# Altium schematic sheet LED_CLUSTER.SchDoc: PDM
size A3; CompanyName: eUSRacing; DrawnBy: Javier González; SheetNumber: 5; SheetTotal: 8
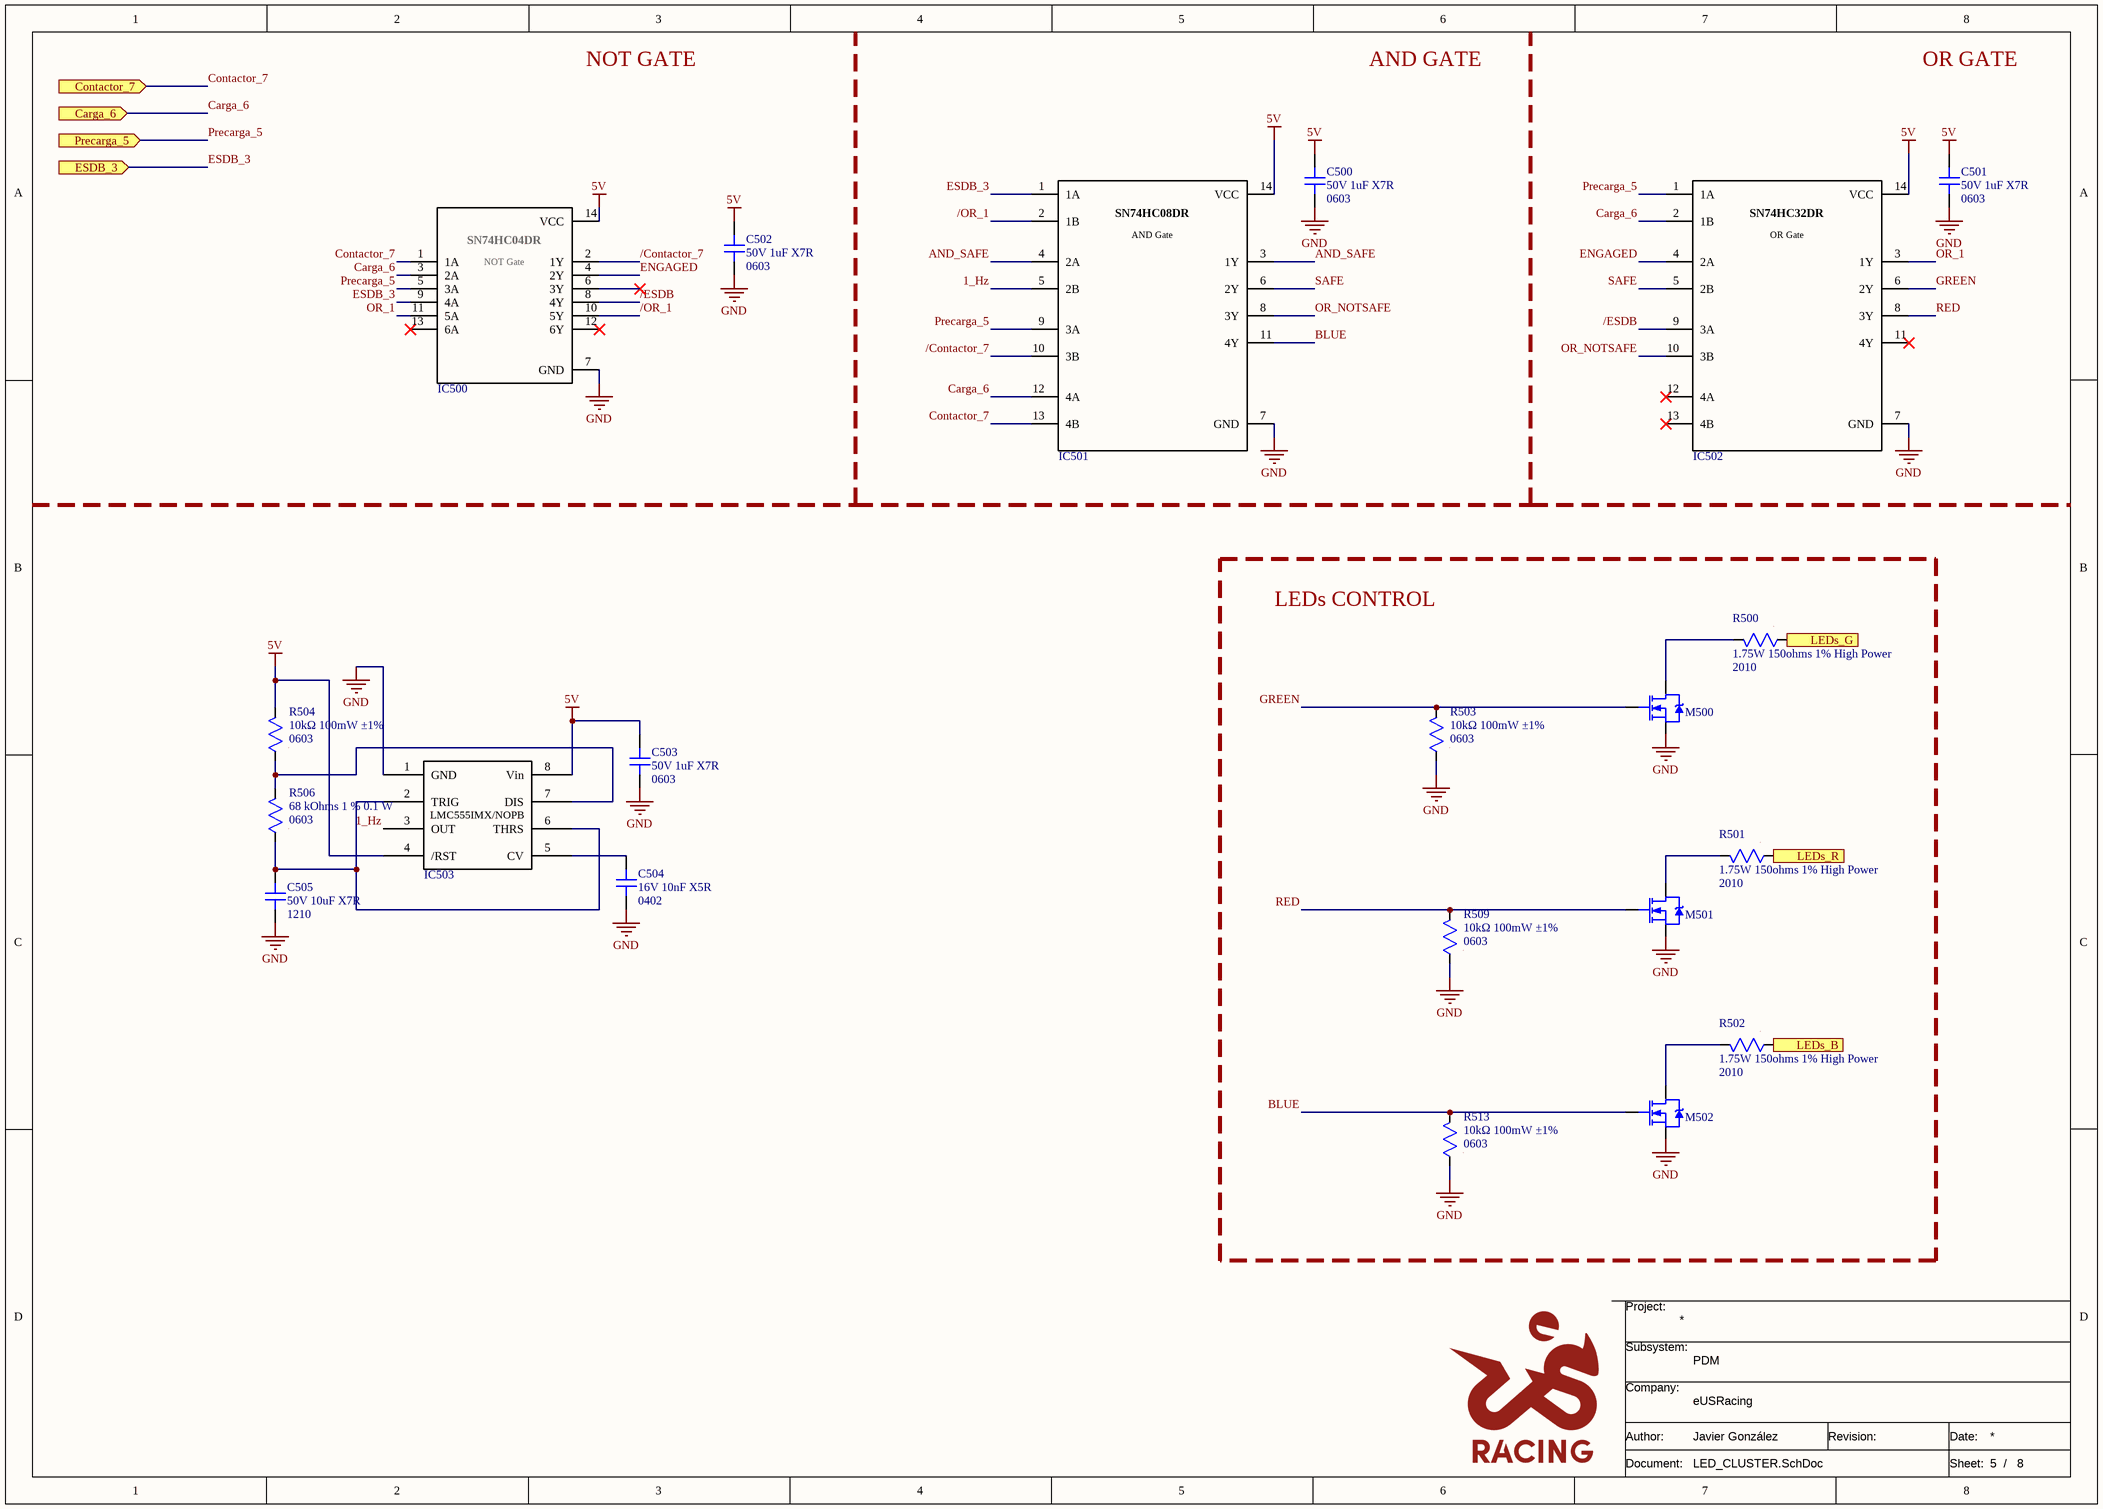
[diagram p0: LED_CLUSTER.SchDoc]

## Parts
C500  value 50V 1uF X7R  Package: 0603  [CAP SMD 0603]  (hidden comment: CAP non polarized)
C501  value 50V 1uF X7R  Package: 0603  [CAP SMD 0603]  (hidden comment: CAP non polarized)
C502  value 50V 1uF X7R  Package: 0603  [CAP SMD 0603]  (hidden comment: CAP non polarized)
C503  value 50V 1uF X7R  Package: 0603  [CAP SMD 0603]  (hidden comment: CAP non polarized)
C504  value 16V 10nF X5R  Package: 0402  [CAP SMD 0402]  (hidden comment: CAP non polarized)
C505  value 50V 10uF X7R  Package: 1210  [CAP SMD 1210]  (hidden comment: CAP non polarized)
IC500  SN74HC04DR  [SOIC-14]  (value not drawn)
IC501  SN74HC08DR  [SOIC-14]  (value not drawn)
IC502  SN74HC32DR  [SOIC-14]  (value not drawn)
IC503  LMC555IMX/NOPB  [SOIC-8]  (value not drawn)
M500  MOSFET N  [SOT-323]  (value not drawn)
M501  MOSFET N  [SOT-323]  (value not drawn)
M502  MOSFET N  [SOT-323]  (value not drawn)
R500  value 1.75W 150ohms 1% High Power  Package: 2010  [RES SMD 2010]  (hidden comment: RES)
R501  value 1.75W 150ohms 1% High Power  Package: 2010  [RES SMD 2010]  (hidden comment: RES)
R502  value 1.75W 150ohms 1% High Power  Package: 2010  [RES SMD 2010]  (hidden comment: RES)
R503  value 10kΩ 100mW ±1%  Package: 0603  [RES SMD 0603]  (hidden comment: RES)
R504  value 10kΩ 100mW ±1%  Package: 0603  [RES SMD 0603]  (hidden comment: RES)
R506  value 68 kOhms 1 % 0.1 W  Package: 0603  [RES SMD 0603]  (hidden comment: RES)
R509  value 10kΩ 100mW ±1%  Package: 0603  [RES SMD 0603]  (hidden comment: RES)
R513  value 10kΩ 100mW ±1%  Package: 0603  [RES SMD 0603]  (hidden comment: RES)

## Blocks framed on the sheet
LEDs CONTROL: M500-M502 R500-R503 R509 R513

## Ports
Carga_6 (in), Contactor_7 (in), ESDB_3 (in), LEDs_B, LEDs_G, LEDs_R, Precarga_5 (in)

## Nets
5V: C500.1 C501.1 C502.1 C503.1 IC500.14(VCC) IC501.14(VCC) IC502.14(VCC) IC503.4(/RST) IC503.8(Vin) R504.2
GND: C500.2 C501.2 C502.2 C503.2 C504.2 C505.2 IC500.7(GND) IC501.7(GND) IC502.7(GND) IC503.1(GND) M500.2(S) M501.2(S) M502.2(S) R503.1 R509.1 R513.1
1_Hz: IC501.5(2B) IC503.3(OUT)
/Contactor_7: IC500.2(1Y) IC501.10(3B)
/ESDB: IC500.8(4Y) IC502.9(3A)
/OR_1: IC500.10(5Y) IC501.2(1B)
AND_SAFE: IC501.3(1Y) IC501.4(2A)
BLUE: IC501.11(4Y) M502.1(G) R513.2
Carga_6: IC500.3(2A) IC501.12(4A) IC502.2(1B) ; port Carga_6
Contactor_7: IC500.1(1A) IC501.13(4B) ; port Contactor_7
ENGAGED: IC500.4(2Y) IC502.4(2A)
ESDB_3: IC500.9(4A) IC501.1(1A) ; port ESDB_3
GREEN: IC502.6(2Y) M500.1(G) R503.2
LEDs_B: R502.1 ; port LEDs_B
LEDs_G: R500.1 ; port LEDs_G
LEDs_R: R501.1 ; port LEDs_R
OR_1: IC500.11(5A) IC502.3(1Y)
OR_NOTSAFE: IC501.8(3Y) IC502.10(3B)
Precarga_5: IC500.5(3A) IC501.9(3A) IC502.1(1A) ; port Precarga_5
RED: IC502.8(3Y) M501.1(G) R509.2
SAFE: IC501.6(2Y) IC502.5(2B)
NetC504_1: C504.1 IC503.5(CV)
NetC505_1: C505.1 IC503.2(TRIG) IC503.6(THRS) R506.1
NetIC503_7: IC503.7(DIS) R504.1 R506.2
NetM500_3: M500.3(D) R500.2
NetM501_3: M501.3(D) R501.2
NetM502_3: M502.3(D) R502.2

Not connected (* = marked no-connect by the designer): IC500 6(3Y)* 12(6Y)* 13(6A)*; IC502 11(4Y)* 12(4A)* 13(4B)*

## Notes on the sheet
- NOT GATE
- AND GATE
- OR GATE
- Project:
- Subsystem:
- Company:
- Document:
- Author:
- Revision:
- Date:
- Sheet:
- /

## Library data of the parts
C500-C503 = 001-0102: Condensadores de cerámica multicapa (MLCC- SMD/SMT) WCAP-CSGP 1uF 50 Vol 10%; MPN: 885012206126; Manufacturer: Wurth Elektronik; ComponentLink1Description: Datasheet; ComponentLink1URL: https://www.we-online.com/components/products/datasheet/885012206126.pdf; ComponentLink2Description: Distributor Link; ComponentLink2URL: https://www.mouser.es/ProductDetail/Wurth-Elektronik/885012206126?qs=amGC7iS6iy%2F%252BJOLb%2FSuwig%3D%3D; ID: 001-0102; Distributor PN: 710-885012206126; Distributor: Mouser
C504 = 001-0101: Condensadores de cerámica multicapa (MLCC- SMD/SMT) WCAP-CSGP 0.01uF 0402 10% 16V MLCC; MPN: 885012205031; Manufacturer: Wurth Elektronik; ComponentLink1Description: Datasheet; ComponentLink1URL: https://www.we-online.com/components/products/datasheet/885012205031.pdf; ComponentLink2Description: Distributor Link; ComponentLink2URL: https://www.mouser.es/ProductDetail/Wurth-Elektronik/885012205031?qs=0KOYDY2FL28GOkIyNosgaQ%3D%3D; ID: 001-0101; Distributor PN: 710-885012205031; Distributor: Mouser
C505 = 001-0104: Condensadores de cerámica multicapa (MLCC- SMD/SMT) WCAP-CSGP 10uF 50Vol 0.1; MPN: 885012209073; Manufacturer: Wurth Elektronik; ComponentLink1Description: Datasheet; ComponentLink1URL: https://www.we-online.com/components/products/datasheet/885012209073.pdf; ComponentLink2Description: Distributor Link; ComponentLink2URL: https://www.mouser.es/ProductDetail/Wurth-Elektronik/885012209073?qs=sPbYRqrBIVm8PsM2ljQIMg%3D%3D; ID: 001-0104; Distributor PN: 710-885012209073; Distributor: Mouser
IC500 = 051-0003: Inversores Hex A 595-SN74HC04D A 595-SN74HC04D A 59 A 595-SN74HC04D; Manufacturer: TI; Value: NOT Gate; ComponentLink1Description: Datasheet; ComponentLink1URL: https://www.ti.com/lit/gpn/sn54hc04-sp; ComponentLink2Description: Distributor Link; ComponentLink2URL: https://eu.mouser.com/es/ProductDetail/Texas-Instruments/SN74HC04DR?qs=5BZzbFV4k2tw1CBjnu%2F%252B9Q%3D%3D; ID: 051-0003; Package: SOIC-14; MPN: SN74HC04DR; Distributor PN: 595-SN74HC04DR; Distributor: Mouser
IC501 = 051-0002: Puertas lógicas Quad 2-Input A 595-S N74HC08D A 595-SN74 A 595-SN74HC08D; Manufacturer: TI; Value: AND Gate; ComponentLink1Description: Datasheet; ComponentLink1URL: https://www.ti.com/lit/gpn/sn54hc08-sp; ComponentLink2Description: Distributor Link; ComponentLink2URL: https://eu.mouser.com/es/ProductDetail/Texas-Instruments/SN74HC08DR?qs=sGAEpiMZZMutXGli8Ay4kEEIpW4eUuOm7aqjfwxQiBw%3D; ID: 051-0002; Package: SOIC-14; MPN: SN74HC08DR; Distributor PN: 595-SN74HC08DR; Distributor: Mouser
IC502 = 051-0001: Puertas lógicas Quad 2-Input A 595-S N74HCT32N A 595-SN7 A 595-SN74HCT32N; Manufacturer: TI; Value: OR Gate; ComponentLink1Description: Datasheet; ComponentLink1URL: https://www.ti.com/lit/gpn/sn74hc32; ComponentLink2Description: Distributor Link; ComponentLink2URL: https://eu.mouser.com/es/ProductDetail/Texas-Instruments/SN74HC32DR?qs=JHHQeKcAU3Du%2FzZijx6RtA%3D%3D; ID: 051-0001; Package: SOIC-14; MPN: SN74HC32DR; Distributor PN: 595-SN74HC32DR; Distributor: Mouser
IC503 = 051-0004: Temporizadores y productos de apoyo CMOS Timer A 595-LMC 555IM/NOPB A 595-LM A 595-LMC555IM/NOPB; Manufacturer: TI; Value: "555"; ComponentLink1Description: Datasheet; ComponentLink1URL: https://www.ti.com/lit/gpn/lmc555; ComponentLink2Description: Distributor Link; ComponentLink2URL: https://eu.mouser.com/es/ProductDetail/Texas-Instruments/LMC555IMX-NOPB?qs=sGAEpiMZZMutXGli8Ay4kNAnUfdQpJkZNpfT8w9oXWg%3D; ID: 051-0004; Package: SOIC-8; MPN: LMC555IMX/NOPB; Distributor PN: 595-LMC555IMX/NOPB; Distributor: Mouser
M500-M502 = 043-0004: MOSFET 30V N-Channel Enhancement Mode MOSFET; MPN: PJC7400_R1_00001; Manufacturer: Panjit; ComponentLink1Description: Datasheet; ComponentLink1URL: https://eu.mouser.com/datasheet/3/3736/1/57EA10CD49B35B6F90316A98635696137E5C0903FA72E2DBB5D027E51D732D72.pdf; ComponentLink2Description: Distributor Link; ComponentLink2URL: https://eu.mouser.com/es/ProductDetail/Panjit/PJC7400_R1_00001?qs=sPbYRqrBIVlqNtfR5hXF4A%3D%3D; ID: 043-0004; Value: N; Package: SOT-323; Distributor PN: 241-PJC7400_R1_00001; Distributor: Mouser
R500-R502 = 010-0197: Resistores de película gruesa - SMD 1.75W 150ohms 1% High Power AEC-Q200; MPN: CRCW2010150RFKEFHP; Manufacturer: Vishay; ComponentLink1Description: Datasheet; ComponentLink1URL: https://www.vishay.com/docs/20043/crcwhpe3.pdf; ComponentLink2Description: Distributor Link; ComponentLink2URL: https://eu.mouser.com/es/ProductDetail/Vishay/CRCW2010150RFKEFHP?qs=sGAEpiMZZMtG0KNrPCHnjUyDcgXu6XhjYS5SmMD6aFQ%3D; ID: 010-0197; Distributor PN: 71-CRCW2010150RFKEFH; Distributor: Mouser
R503 R504 R509 R513 = 010-0145: Resistores de película gruesa - SMD WRIS-RSKS 10 kOhms 1 % 0.1 W 0603 AEC-Q200; MPN: 560112116005; Manufacturer: Wurth Elektronik; ComponentLink1Description: Datasheet; ComponentLink1URL: https://www.we-online.com/components/products/datasheet/560112116005.pdf; ComponentLink2Description: Distributor Link; ComponentLink2URL: https://www.mouser.es/ProductDetail/Wurth-Elektronik/560112116005?qs=mELouGlnn3dMVSPHwBGouA%3D%3D; ID: 010-0145; Distributor PN: 710-560112116005; Distributor: Mouser
R506 = 010-0196: Resistores de película gruesa - SMD WRIS-RSKS 68 kOhms 1 % 0.1 W 0603 AEC-Q200; MPN: 560112116064; Manufacturer: Wurth Elektronik; ComponentLink1Description: Datasheet; ComponentLink1URL: https://www.we-online.com/catalog/datasheet/560112116064.pdf; ComponentLink2Description: Distributor Link; ComponentLink2URL: https://eu.mouser.com/es/ProductDetail/Wurth-Elektronik/560112116064?qs=mELouGlnn3f1GMEHw9Tsbg%3D%3D; ID: 010-0196; Distributor PN: 710-560112116064; Distributor: Mouser